# Altium schematic sheet NX32F001T-塑料壳扳手角磨链锯通用.SchDoc
size A3; DrawnBy: Jason; Address1: 广东省深圳市南山区; Address2: 西丽石鼓路国际创新谷8栋A座18楼; Revision: v1.0; Tel: 0755-83297500; Size: A4; CurrPage: 1; TotalPage: 1
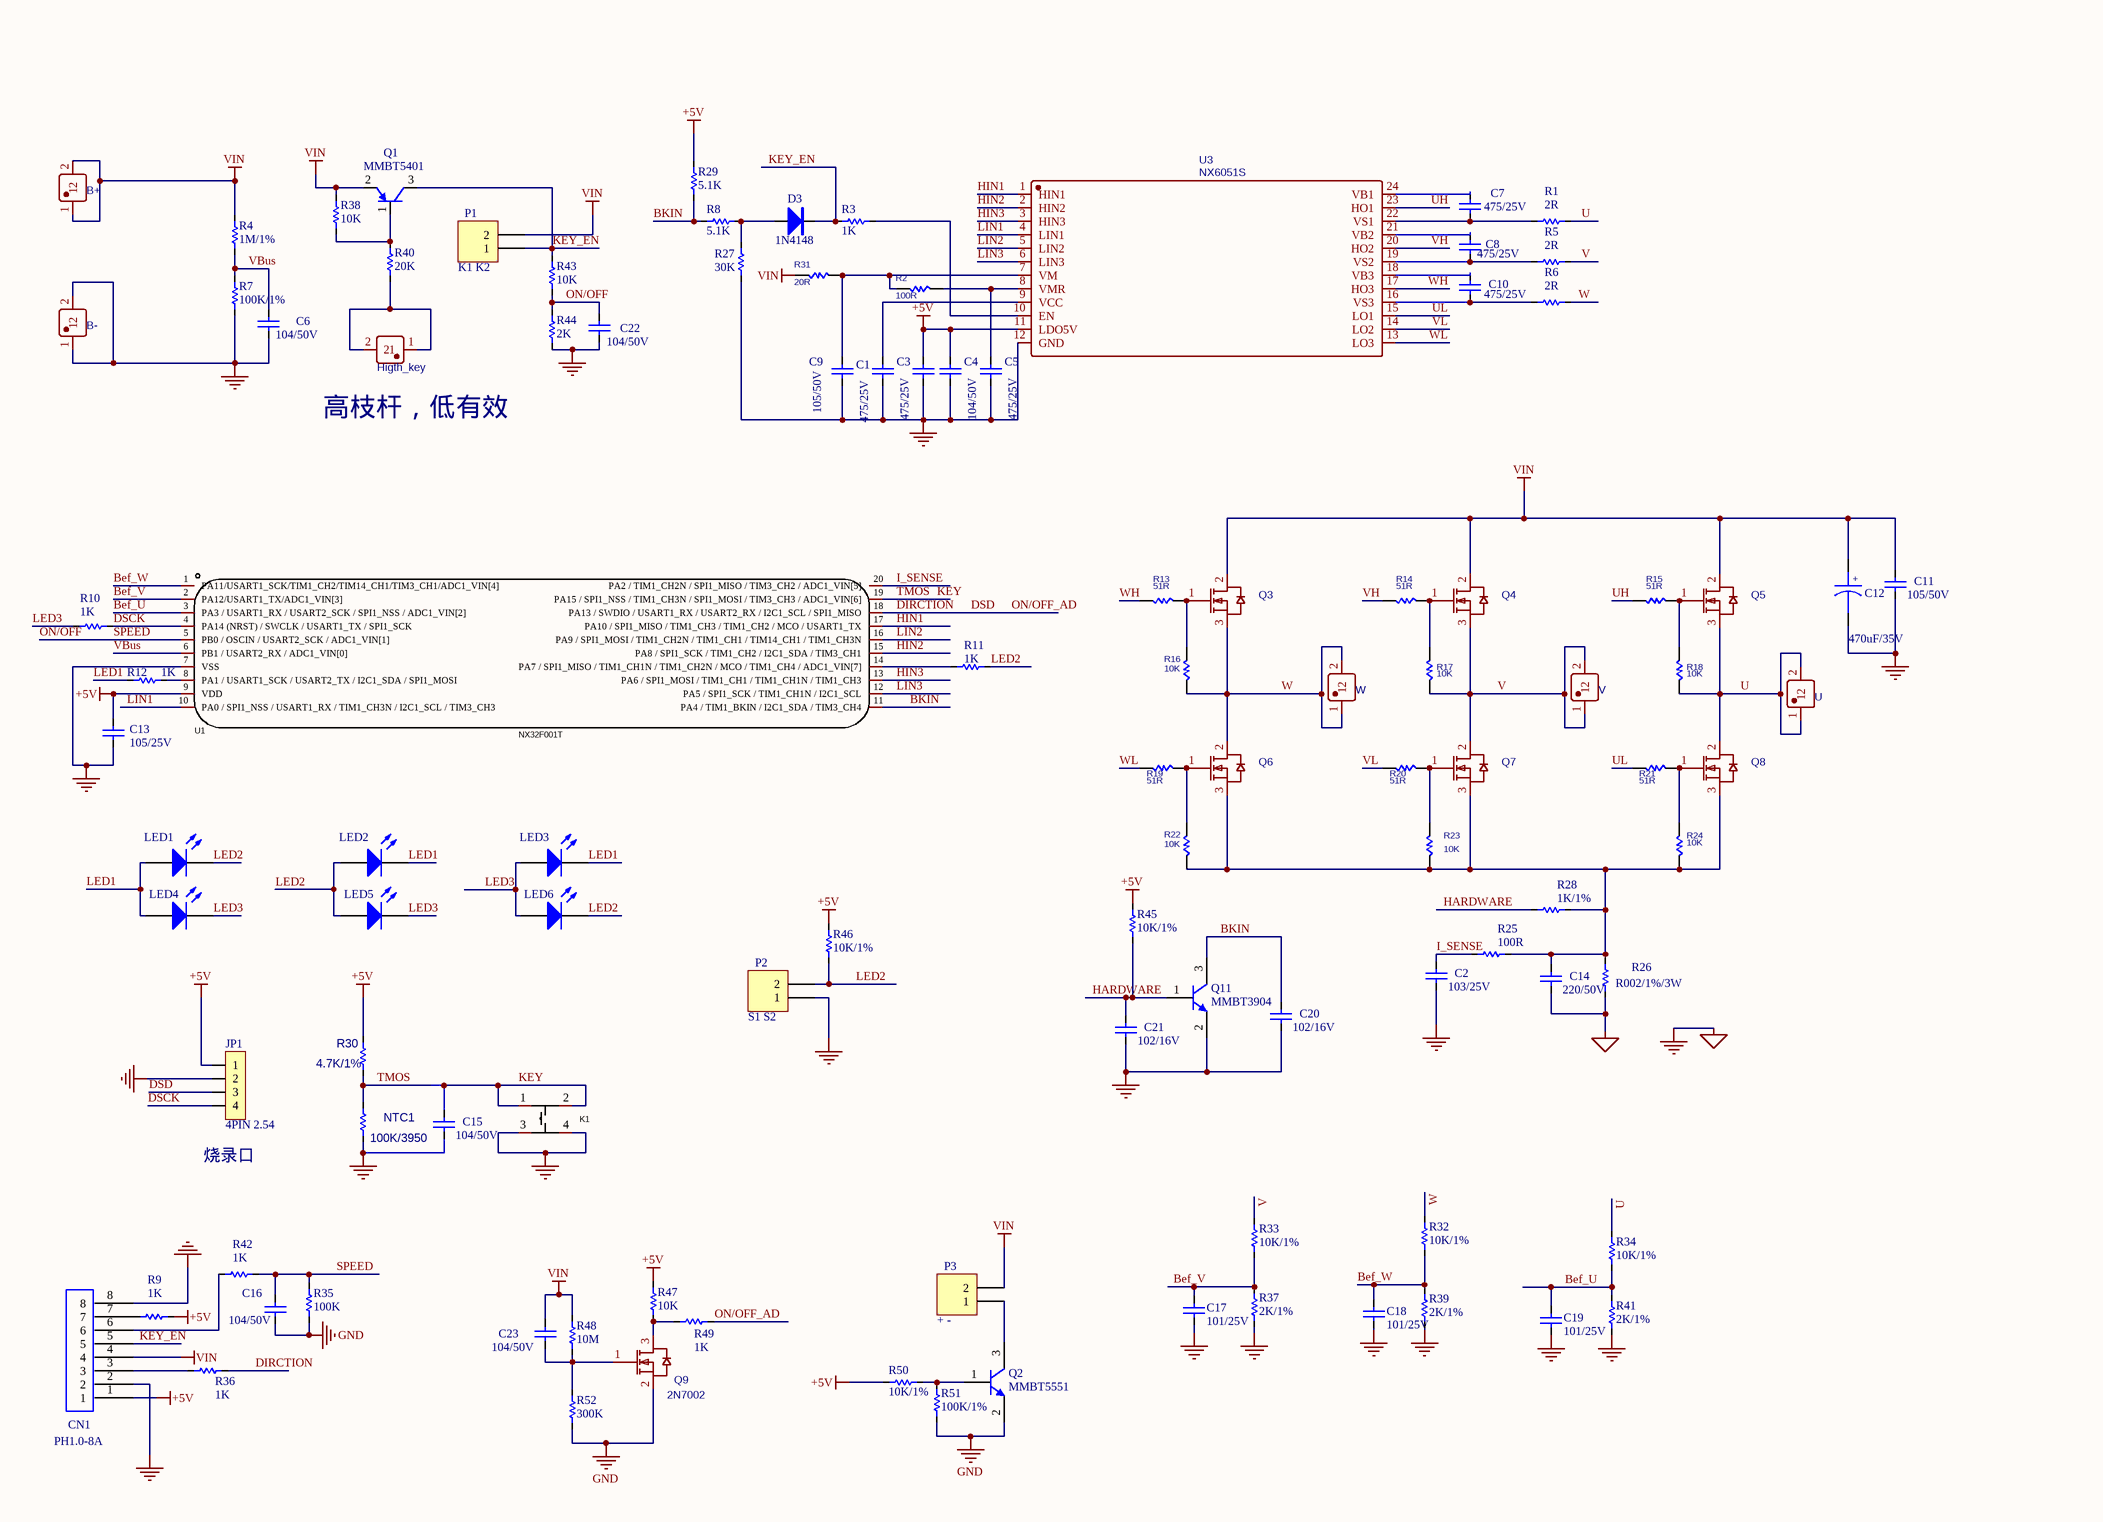
[diagram p0: NX32F001T-塑料壳扳手角磨链锯通用.SchDoc]

## Parts
1  B+  [PAD-16AWG]
2  B-  [PAD-16AWG]
3  Higth_key  [PAD-16AWG]
C1  475/25V  [C0603]
C2  103/25V  [C0402]
C3  475/25V  [C0603]
C4  104/50V  [C0402]
C5  475/25V  [C0603]
C6  104/50V  [C0402]
C7  475/25V  [C0603]
C8  475/25V  [C0603]
C9  105/50V  [C0603]
C10  475/25V  [C0603]
C11  105/50V  [C0603]
C12  470uF/35V  [CAP-TH_BD10.0-P5.00-D0.6-FD]
C13  105/25V  [C0402]
C14  220/50V  [C0402]
C15  104/50V  [C0402]
C16  104/50V  [C0402]
C17  101/25V  [C0402]
C18  101/25V  [C0402]
C19  101/25V  [C0402]
C20  102/16V  [C0402]
C21  102/16V  [C0402]
C22  104/50V  [C0402]
C23  104/50V  [C0402]
CN1  PH1.0-8A  [PH1.0-8A]
D3  1N4148  [SOD-323A]
JP1  value 4PIN 2.54  [HDR1X4]  (hidden comment: + -DSD DSCK)
K1  (no value)  [DOT6X6SMT]
LED1  (no value)  [0603_LED]
LED2  (no value)  [0603_LED]
LED3  (no value)  [0603_LED]
LED4  (no value)  [0603_LED]
LED5  (no value)  [0603_LED]
LED6  (no value)  [0603_LED]
NTC1  100K/3950  [R0603]
P1  K1 K2  [HDR1X2]
P2  S1 S2  [HDR1X2]
P3  + -  [HDR1X2]
Q1  MMBT5401  [SOT-23-3]
Q2  MMBT5551  [SOT-23-3]
Q3  (no value)  [TO-252-2-180]
Q4  (no value)  [TO-252-2-180]
Q5  (no value)  [TO-252-2-180]
Q6  (no value)  [TO-252-2-180]
Q7  (no value)  [TO-252-2-180]
Q8  (no value)  [TO-252-2-180]
Q9  2N7002  [SOT-23-3]
Q11  MMBT3904  [SOT-23-3]
R1  2R  [R0402]
R2  100R  [R0805]
R3  1K  [R0402]
R4  1M/1%  [R0402]
R5  2R  [R0402]
R6  2R  [R0402]
R7  100K/1%  [R0402]
R8  5.1K  [R0402]
R9  1K  [R0402]
R10  1K  [R0402]
R11  1K  [R0402]
R12  1K  [R0402]
R13  51R  [R0402]
R14  51R  [R0402]
R15  51R  [R0402]
R16  10K  [R0402]
R17  10K  [R0402]
R18  10K  [R0402]
R19  51R  [R0402]
R20  51R  [R0402]
R21  51R  [R0402]
R22  10K  [R0402]
R23  10K  [R0402]
R24  10K  [R0402]
R25  100R  [R0402]
R26  R002/1%/3W  [R 2512]
R27  30K  [R0402]
R28  1K/1%  [R0402]
R29  5.1K  [R0402]
R30  4.7K/1%  [R0402]
R31  20R  [R0805]
R32  10K/1%  [R0402]
R33  10K/1%  [R0402]
R34  10K/1%  [R0402]
R35  100K  [R0402]
R36  1K  [R0402]
R37  2K/1%  [R0402]
R38  10K  [R0402]
R39  2K/1%  [R0402]
R40  20K  [R0402]
R41  2K/1%  [R0402]
R42  1K  [R0402]
R43  10K  [R0402]
R44  2K  [R0402]
R45  10K/1%  [R0402]
R46  10K/1%  [R0402]
R47  10K  [R0402]
R48  10M  [R0402]
R49  1K  [R0402]
R50  10K/1%  [R0402]
R51  100K/1%  [R0402]
R52  300K  [R0402]
U  U  [CONN-TH_L6.3-W0.8-EST026]
U1  NX32F001T  [TSSOP20_L6.5-W4.4-P0.65-LS6.4-BL]
U3  NX6051S  [SSOP-24_L8.8-W4.0-P0.64-LS6.2-BL]
V  V  [CONN-TH_L6.3-W0.8-EST026]
W  W  [CONN-TH_L6.3-W0.8-EST026]

## Nets
+5V: C3.2 C4.2 C13.2 CN1.1 JP1.1 R9.1 R29.2 R30.1 R45.2 R46.2 R47.1 R50.2 U1.9(VDD) U3.11(LDO5V)
GND: 2.1 2.2 C1.1 C2.1 C3.1 C4.1 C5.1 C6.1 C9.1 C11.1 C12.2 C13.1 C14.1 C15.1 C16.1 C17.1 C18.1 C19.1 C20.1 C21.1 C22.1 CN1.2 CN1.8 JP1.2 K1.3 K1.4 NTC1.2 P2.1 Q2.2(E) Q9.2(S) Q11.2(E) R7.1 R26.1 R27.1 R35.1 R37.2 R39.2 R41.2 R44.1 R51.1 R52.2 U1.7(VSS) U3.12(GND)
VIN: 1.1 1.2 C11.2 C12.1 C23.2 CN1.4 P1.2 P3.2 Q1.2(E) Q3.2(D) Q4.2(D) Q5.2(D) R4.2 R31.2 R38.1 R48.1
Bef_U: C19.2 R34.2 R41.1 U1.3(PA3_/_USART1_RX_/_USART2_SCK_/_SPI1_NSS_/_ADC1_VIN[2])
Bef_V: C17.2 R33.2 R37.1 U1.2(PA12/USART1_TX/ADC1_VIN[3])
Bef_W: C18.2 R32.2 R39.1 U1.1(PA11/USART1_SCK/TIM1_CH2/TIM14_CH1/TIM3_CH1/ADC1_VIN[4])
BKIN: C20.2 Q11.3(C) R8.1 R29.1 U1.11(PA4_/_TIM1_BKIN_/_I2C1_SDA_/_TIM3_CH4)
DIRCTION: JP1.3 R36.1 R49.2 U1.18(PA13_/_SWDIO_/_USART1_RX_/_USART2_RX_/_I2C1_SCL_/_SPI1_MISO)  [also labelled DSD, ON/OFF_AD]
DSCK: JP1.4 R10.1 U1.4(PA14_(NRST)_/_SWCLK_/_USART1_TX_/_SPI1_SCK)
HARDWARE: C21.2 Q11.1(B) R28.1 R45.1
HIN1: U1.17(PA10_/_SPI1_MISO_/_TIM1_CH3_/_TIM1_CH2_/_MCO_/_USART1_TX) U3.1(HIN1)
HIN2: U1.15(PA8_/_SPI1_SCK_/_TIM1_CH2_/_I2C1_SDA_/_TIM3_CH1) U3.2(HIN2)
HIN3: U1.13(PA6_/_SPI1_MOSI_/_TIM1_CH1_/_TIM1_CH1N_/_TIM1_CH3) U3.3(HIN3)
I_SENSE: C2.2 R25.1 U1.20(PA2_/_TIM1_CH2N_/_SPI1_MISO_/_TIM3_CH2_/_ADC1_VIN[5])
KEY: C15.2 K1.1 K1.2 NTC1.1 R30.2 U1.19(PA15_/_SPI1_NSS_/_TIM1_CH3N_/_SPI1_MOSI_/_TIM3_CH3_/_ADC1_VIN[6])  [also labelled TMOS]
KEY_EN: CN1.5 D3.2(K) P1.1 Q1.3(C) R3.2 R43.1
LED1: LED1.A LED2.K LED3.K LED4.A R12.2
LED2: LED1.K LED2.A LED5.A LED6.K P2.2 R11.2 R46.1
LED3: LED3.A LED4.K LED5.K LED6.A R10.2
LIN1: U1.10(PA0_/_SPI1_NSS_/_USART1_RX_/_TIM1_CH3N_/_I2C1_SCL_/_TIM3_CH3) U3.4(LIN1)
LIN2: U1.16(PA9_/_SPI1_MOSI_/_TIM1_CH2N_/_TIM1_CH1_/_TIM14_CH1_/_TIM1_CH3N) U3.5(LIN2)
LIN3: U1.12(PA5_/_SPI1_SCK_/_TIM1_CH1N_/_I2C1_SCL) U3.6(LIN3)
ON/OFF: C16.2 C22.2 R35.2 R42.1 R43.2 R44.2 U1.5(PB0_/_OSCIN_/_USART2_SCK_/_ADC1_VIN[1])  [also labelled SPEED]
U: Q5.3(S) Q8.2(D) R1.1 R18.2 R34.1 U.1 U.2
UH: R15.1 U3.23(HO1)
UL: R21.1 U3.15(LO1)
V: Q4.3(S) Q7.2(D) R5.1 R17.2 R33.1 V.1 V.2
VBus: C6.2 R4.1 R7.2 U1.6(PB1_/_USART2_RX_/_ADC1_VIN[0])
VH: R14.1 U3.20(HO2)
VL: R20.1 U3.14(LO2)
W: Q3.3(S) Q6.2(D) R6.1 R16.2 R32.1 W.1 W.2
WH: R13.1 U3.17(HO3)
WL: R19.1 U3.13(LO3)
Net3_1: 3.1 3.2 R40.2
NetC1_2: C1.2 U3.9(VCC)
NetC5_2: C5.2 R2.2 U3.8(VMR)
NetC7_1: C7.1 R1.2 U3.22(VS1)
NetC7_2: C7.2 U3.24(VB1)
NetC8_1: C8.1 R5.2 U3.19(VS2)
NetC8_2: C8.2 U3.21(VB2)
NetC9_2: C9.2 R2.1 R31.1 U3.7(VM)
NetC10_1: C10.1 R6.2 U3.16(VS3)
NetC10_2: C10.2 U3.18(VB3)
NetC14_2: C14.2 Q6.3(S) Q7.3(S) Q8.3(S) R22.2 R23.2 R24.2 R25.2 R26.2 R28.2
NetC23_1: C23.1 Q9.1(G) R48.2 R52.1
NetCN1_3: CN1.3 R36.2
NetCN1_6: CN1.6 R42.2
NetCN1_7: CN1.7 R9.2
NetD3_1: D3.1(A) R8.2 R27.2
NetP3_1: P3.1 Q2.3(C)
NetQ1_1: Q1.1(B) R38.2 R40.1
NetQ2_1: Q2.1(B) R50.1 R51.2
NetQ3_1: Q3.1(G) R13.2 R16.1
NetQ4_1: Q4.1(G) R14.2 R17.1
NetQ5_1: Q5.1(G) R15.2 R18.1
NetQ6_1: Q6.1(G) R19.2 R22.1
NetQ7_1: Q7.1(G) R20.2 R23.1
NetQ8_1: Q8.1(G) R21.2 R24.1
NetQ9_3: Q9.3(D) R47.2 R49.1
NetR3_1: R3.1 U3.10(EN)
NetR11_1: R11.1 U1.14(PA7_/_SPI1_MISO_/_TIM1_CH1N_/_TIM1_CH2N_/_MCO_/_TIM1_CH4_/_ADC1_VIN[7])
NetR12_1: R12.1 U1.8(PA1_/_USART1_SCK_/_USART2_TX_/_I2C1_SDA_/_SPI1_MOSI)

## Notes on the sheet
- (near 3) 高枝杆，低有效
- (near JP1) 烧录口
- (in symbol CAP+) +

## Library data of the parts
1-3 U V W = EST026: 接线插片; BOM_Manufacturer: xcfuse(旭程); Contributor: LCSC; BOM_Supplier: LCSC; BOM_Supplier Part: C52878; BOM_Manufacturer Part: EST026; BOM_JLCPCB Part Class: Extended Part; spicePre: U; spiceSymbolName: EST026
C1-C11 C13-C23 = C: 无极性电容; value: 100nF; volt: 16V
C12 = CAP+: 直插电解电容
CN1 = CON8: 8pin 开关贴片座子
D3 = DIODE: 二极管
JP1 = HEAD4: 4PIN端子
K1 = TS-1002S-07526C: 轻触按键; Designer: U?; Symbol: TS-1002S-07526C; Device: TS-1002S-07526C
LED1-LED6 = 0603 蓝灯: 发光二极管; ComponentLink1Description: 供应商链接; ComponentLink1URL: http://www.szlcsc.com/product/details_73150.html; Package: 0603; Supplier: LC; SuppliersPartNumber: C72041
NTC1 = Res: 贴片热敏电阻; Published: 8-Jun-2000; LatestRevisionDate: 17-Jul-2002; LatestRevisionNote: Re-released for DXP Platform.; Publisher: Altium Limited
P1-P3 = Header 2: Header, 2-Pin; LatestRevisionDate: 17-Jul-2002; LatestRevisionNote: Re-released for DXP Platform.; Publisher: Altium Limited
Q1 = SOT-23 SS8550 Y2: PNP三极管; ComponentLink1Description: 供应商链接; ComponentLink1URL: http://www.szlcsc.com/product/details_9037.html; Package: SOT-23; Supplier: LC; SuppliersPartNumber: C8542
Q2 Q11 = 2N3904: NPN General Purpose Amplifier; Published: 8-Jun-2000; LatestRevisionDate: 15-Jan-2003; LatestRevisionNote: PCB Footprint 'BCY-W3/D4.7' replaced; DatasheetVersion: 1997; PackageVersion: Sep-1998; PackageReference: TO-92A; Publisher: Altium Limited; PackageDescription: TO, Flat Index; 3 In-Line, Axial Leads; Body Dia. 4.5mm; Leads 0.51 x 0.48 mm (max); ComponentLink1Description: Manufacturer Link; ComponentLink1URL: http://www.fairchildsemi.com/; ComponentLink2Description: Datasheet; ComponentLink2URL: http://www.fairchildsemi.com/ds/2N%2F2N3904.pdf
Q3-Q9 = NCE3050K: N-Channel mosfet; BOM_Manufacturer: Ncepower; BOM_Supplier: LCSC; BOM_Manufacturer Part: NCE3050K; BOM_Supplier Part: C127863; BOM_JLCPCB Part Class: Extended Part; spicePre: Q; spiceSymbolName: NCE3050K
R1 R3-R12 R25 R27-R29 R32-R52 = R: 贴片电阻; value: 10K 1%
R2 R13-R24 R31 = RES: 贴片电阻
R26 = R: 贴片合金电阻; value: 10K 1%
R30 = Res: 贴片电阻; Published: 8-Jun-2000; LatestRevisionDate: 17-Jul-2002; LatestRevisionNote: Re-released for DXP Platform.; Publisher: Altium Limited
U1 = 0001: 主控IC; Manufacturer: MindMotion(灵动微); Name: MM32L073TW; Add into BOM: yes; CPU Core: CM0; Program Storage Size: 128KB; RAM Size: 8KB; GPIO Ports Number: 16; Operating Voltage Range: 2V~5.5V; CPU Maximum Speed: 48MHz; Program Memory Type: FLASH; ADC (Bit): 12bit; PWM (Bit): 16bit; 16Bit Timer: 4; 32Bit Timer: 1; Universal Serial Bus: 有; Peripheral/Function: 低电压检测；看门狗；CCP捕获/比较；片载温度传感器；DMA; Symbol: MM32L073TW; Device: MM32L073TW; LCSC Part Name: MM32L073TW; Supplier Part: C316706; Manufacturer Part: MM32L073TW; Supplier Footprint: ETSSOP20; JLCPCB Part Class: Extended Part; Datasheet: https://atta.szlcsc.com/upload/public/pdf/source/20181108/C316706_D58D5F47163545E30AD1B5FAEBB0C13E.pdf; Supplier: LCSC; Convert to PCB: yes; Operating Temperature Range: -; DAC (Bit): -; 8Bit Timer: -; CAN: 1; UART/USART: 1; I2C: 1; I2S: -; SPI: 1; Internal Comparator: 有; communication protocol: -; Watchdog: 有; Real-Time Clock: -; Infrared Data Association: -; Low-Voltage Detect: 有; CCP Capture/Compare: 有; Secure Digital Input and Output: -; Direct Memory Access: 有; Internal Oscillator: 有
U3 = HC89F0531-SSOP24-T-M: 合封驱动IC; BOM_Manufacturer: Shanghai Holychip Elec; Contributor: LCSC; BOM_Supplier: LCSC; BOM_Supplier Part: C710315; BOM_Manufacturer Part: HC89F0531-SSOP24-T-M; BOM_JLCPCB Part Class: Extended Part; spicePre: U; spiceSymbolName: HC89F0531-SSOP24-T-M